# Altium schematic sheet Turret_Power.SchDoc: PCB Projet Guimbarde Power
size Letter; ApprovedBy: APPROUVÉ PAR; Author: Alexandre Dionne; Organization: Cegep Limoilou; Address1: 1300, 8e Avenue; Address2: Québec, QC; Address3: Canada; Address4: G1J 5L5; Revision: A; SheetNumber: 1; SheetTotal: 3
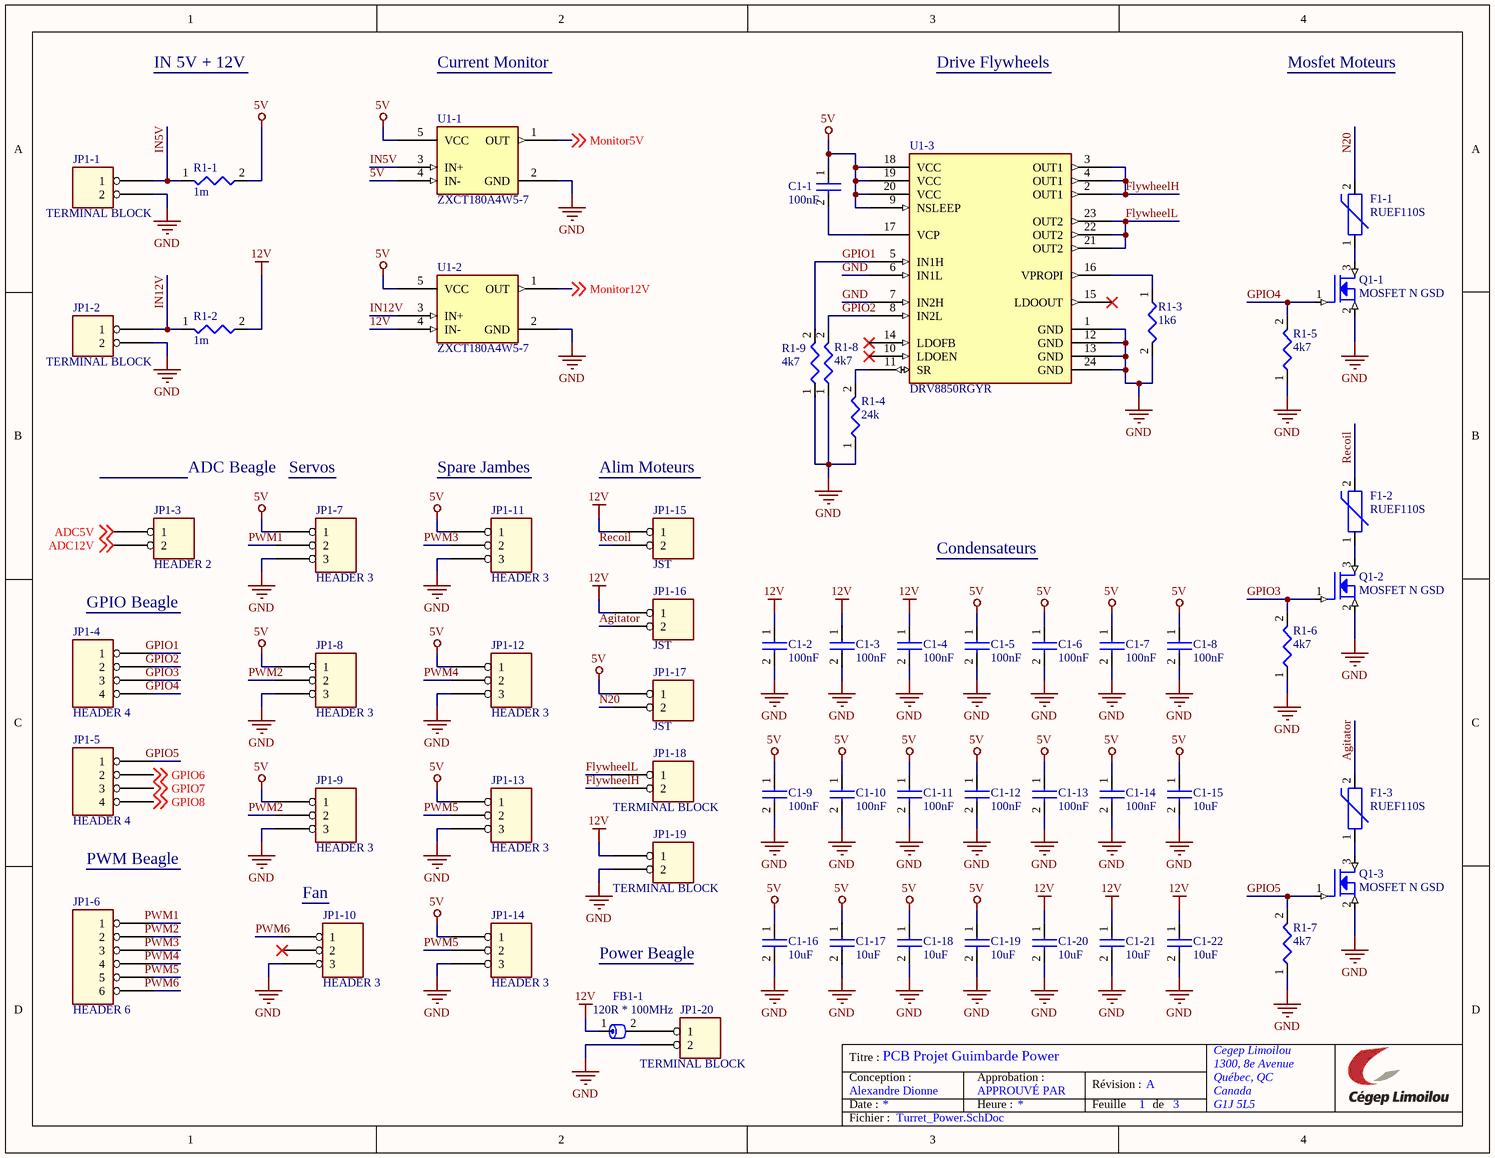
[diagram p0: Turret_Power.SchDoc]

## Parts
C1-1  100nF  [CAP_0603]
C1-2  100nF  [CAP_0603]
C1-3  100nF  [CAP_0603]
C1-4  100nF  [CAP_0603]
C1-5  100nF  [CAP_0603]
C1-6  100nF  [CAP_0603]
C1-7  100nF  [CAP_0603]
C1-8  100nF  [CAP_0603]
C1-9  100nF  [CAP_0603]
C1-10  100nF  [CAP_0603]
C1-11  100nF  [CAP_0603]
C1-12  100nF  [CAP_0603]
C1-13  100nF  [CAP_0603]
C1-14  100nF  [CAP_0603]
C1-15  10uF  [CAP_0603]
C1-16  10uF  [CAP_0603]
C1-17  10uF  [CAP_0603]
C1-18  10uF  [CAP_0603]
C1-19  10uF  [CAP_0603]
C1-20  10uF  [CAP_0603]
C1-21  10uF  [CAP_0603]
C1-22  10uF  [CAP_0603]
F1-1  RUEF110S  [MINISMDC110F/24-2]
F1-2  RUEF110S  [MINISMDC110F/24-2]
F1-3  RUEF110S  [MINISMDC110F/24-2]
FB1-1  120R * 100MHz  [MFBM1V3216-121-R]
JP1-1  TERMINAL BLOCK  [TB005-762-02BE]
JP1-2  TERMINAL BLOCK  [TB005-762-02BE]
JP1-3  HEADER 2  [Header_2]
JP1-4  HEADER 4  [Header_4]
JP1-5  HEADER 4  [Header_4]
JP1-6  HEADER 6  [Header_6]
JP1-7  HEADER 3  [Header_3]
JP1-8  HEADER 3  [Header_3]
JP1-9  HEADER 3  [Header_3]
JP1-10  HEADER 3  [Header_3]
JP1-11  HEADER 3  [Header_3]
JP1-12  HEADER 3  [Header_3]
JP1-13  HEADER 3  [Header_3]
JP1-14  HEADER 3  [Header_3]
JP1-15  JST  [B2B-PH-K-S]
JP1-16  JST  [B2B-PH-K-S]
JP1-17  JST  [B2B-PH-K-S]
JP1-18  TERMINAL BLOCK  [TB005-762-02BE]
JP1-19  TERMINAL BLOCK  [TB005-762-02BE]
JP1-20  TERMINAL BLOCK  [TB005-762-02BE]
Q1-1  MOSFET N GSD  [GSFC2312]
Q1-2  MOSFET N GSD  [GSFC2312]
Q1-3  MOSFET N GSD  [GSFC2312]
R1-1  1m  [RES_1206]
R1-2  1m  [RES_1206]
R1-3  1k6  [RES_0603]
R1-4  24k  [RES_0603]
R1-5  4k7  [RES_0603]
R1-6  4k7  [RES_0603]
R1-7  4k7  [RES_0603]
R1-8  4k7  [RES_0603]
R1-9  4k7  [RES_0603]
U1-1  ZXCT180A4W5-7  [ZXCT180A4W5-7]
U1-2  ZXCT180A4W5-7  [ZXCT180A4W5-7]
U1-3  DRV8850RGYR  [DRV8850]

## Nets
5V: C1-1.1 C1-5.1 C1-6.1 C1-7.1 C1-8.1 C1-9.1 C1-10.1 C1-11.1 C1-12.1 C1-13.1 C1-14.1 C1-15.1 C1-16.1 C1-17.1 C1-18.1 C1-19.1 JP1-7.1 JP1-8.1 JP1-9.1 JP1-11.1 JP1-12.1 JP1-13.1 JP1-14.1 JP1-17.1 R1-1.2 U1-1.4(IN-) U1-1.5(VCC) U1-2.5(VCC) U1-3.9(NSLEEP) U1-3.18(VCC) U1-3.19(VCC) U1-3.20(VCC)
12V: C1-2.1 C1-3.1 C1-4.1 C1-20.1 C1-21.1 C1-22.1 FB1-1.1 JP1-15.1 JP1-16.1 JP1-19.1 R1-2.2 U1-2.4(IN-)
GND: C1-2.2 C1-3.2 C1-4.2 C1-5.2 C1-6.2 C1-7.2 C1-8.2 C1-9.2 C1-10.2 C1-11.2 C1-12.2 C1-13.2 C1-14.2 C1-15.2 C1-16.2 C1-17.2 C1-18.2 C1-19.2 C1-20.2 C1-21.2 C1-22.2 JP1-1.2 JP1-2.2 JP1-7.3 JP1-8.3 JP1-9.3 JP1-10.3 JP1-11.3 JP1-12.3 JP1-13.3 JP1-14.3 JP1-19.2 JP1-20.2 Q1-1.2(SOURCE) Q1-2.2(SOURCE) Q1-3.2(SOURCE) R1-3.2 R1-4.1 R1-5.1 R1-6.1 R1-7.1 R1-8.1 R1-9.1 U1-1.2(GND) U1-2.2(GND) U1-3.1(GND) U1-3.6(IN1L) U1-3.7(IN2H) U1-3.12(GND) U1-3.13(GND) U1-3.24(GND)
ADC5V: JP1-3.1 ; off-sheet ADC5V
ADC12V: JP1-3.2 ; off-sheet ADC12V
Agitator: F1-3.2 JP1-16.2
FlywheelH: JP1-18.2 U1-3.2(OUT1) U1-3.3(OUT1) U1-3.4(OUT1)
FlywheelL: JP1-18.1 U1-3.21(OUT2) U1-3.22(OUT2) U1-3.23(OUT2)
GPIO1: JP1-4.1 R1-9.2 U1-3.5(IN1H)
GPIO2: JP1-4.2 R1-8.2 U1-3.8(IN2L)
GPIO3: JP1-4.3 Q1-2.1(GATE) R1-6.2
GPIO4: JP1-4.4 Q1-1.1(GATE) R1-5.2
GPIO5: JP1-5.1 Q1-3.1(GATE) R1-7.2
GPIO6: JP1-5.2 ; off-sheet GPIO6
GPIO7: JP1-5.3 ; off-sheet GPIO7
GPIO8: JP1-5.4 ; off-sheet GPIO8
IN5V: JP1-1.1 R1-1.1 U1-1.3(IN+)
IN12V: JP1-2.1 R1-2.1 U1-2.3(IN+)
Monitor5V: U1-1.1(OUT) ; off-sheet Monitor5V
Monitor12V: U1-2.1(OUT) ; off-sheet Monitor12V
N20: F1-1.2 JP1-17.2
PWM1: JP1-6.1 JP1-7.2
PWM2: JP1-6.2 JP1-8.2 JP1-9.2
PWM3: JP1-6.3 JP1-11.2
PWM4: JP1-6.4 JP1-12.2
PWM5: JP1-6.5 JP1-13.2 JP1-14.2
PWM6: JP1-6.6 JP1-10.1
Recoil: F1-2.2 JP1-15.2
NetC1-1_2: C1-1.2 U1-3.17(VCP)
NetF1-1_1: F1-1.1 Q1-1.3(DRAIN)
NetF1-2_1: F1-2.1 Q1-2.3(DRAIN)
NetF1-3_1: F1-3.1 Q1-3.3(DRAIN)
NetFB1-1_2: FB1-1.2 JP1-20.1
NetR1-3_1: R1-3.1 U1-3.16(VPROPI)
NetR1-4_2: R1-4.2 U1-3.11(SR)

Not connected (* = marked no-connect by the designer): JP1-10 2*; U1-3 10(LDOEN)* 14(LDOFB)* 15(LDOOUT)*

## Notes on the sheet
- IN 5V + 12V
- Current Monitor
- Drive Flywheels
- Mosfet Moteurs
- ADC Beagle
- Servos
- Spare Jambes
- Alim Moteurs
- Condensateurs
- GPIO Beagle
- PWM Beagle
- (near JP1-10) Fan
- Power Beagle
- Titre :
- Conception :
- Date :
- Approbation :
- Heure :
- Révision :
- Feuille
- de
- Fichier :

## Library data of the parts
C1-1-C1-22 = CAP NP
F1-1-F1-3 = Polyswitch
FB1-1 = Ferrite
JP1-1 JP1-2 JP1-15-JP1-20 = HEADER 2
R1-1-R1-9 = R
U1-3 = DRV8850RGYR: No Description Available; Mfr_Name: Texas Instruments; RefDes: RefDes; Type: Type